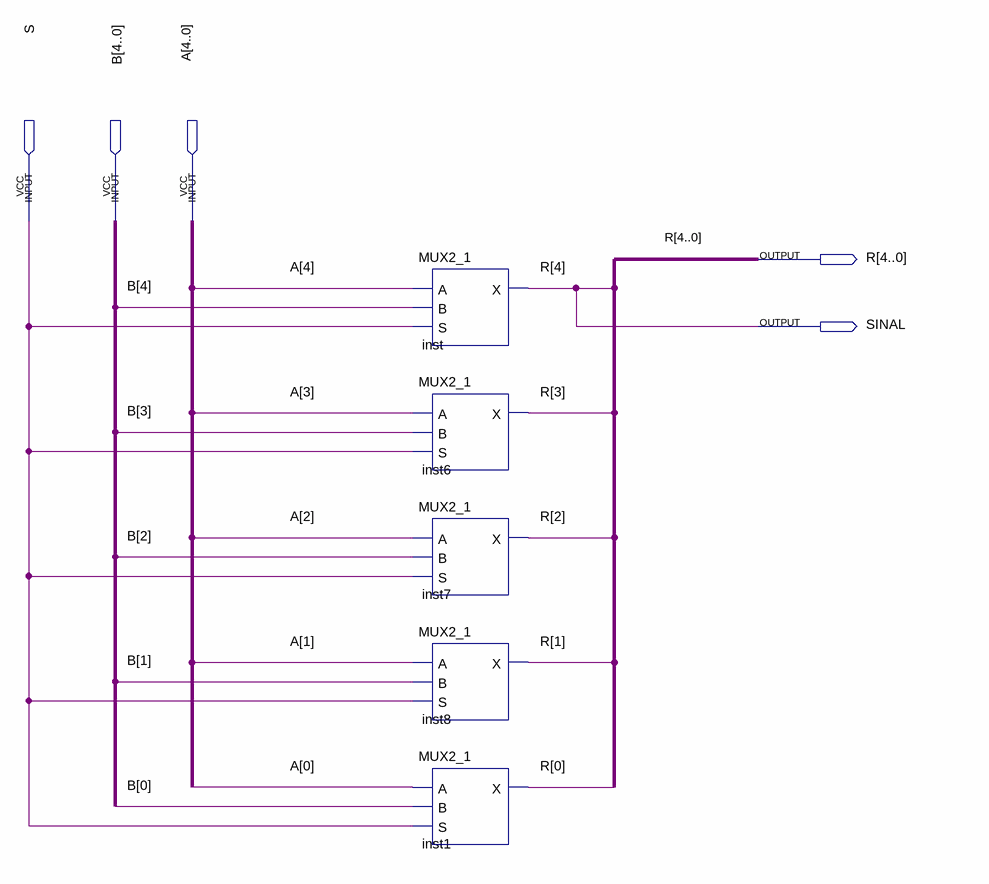
[diagram p0: schematic sheet]
// Quartus schematic MUX2_1_5BITS.bdf as structural Verilog: 5 symbols, 5 pins
module MUX2_1_5BITS (
  input  S,
  input  [4:0] B,
  input  [4:0] A,
  output [4:0] R,
  output SINAL
);

  MUX2_1 inst (.A(A[4]), .B(B[4]), .S(S), .X(R[4]));
  MUX2_1 inst6 (.A(A[3]), .B(B[3]), .S(S), .X(R[3]));
  MUX2_1 inst7 (.A(A[2]), .B(B[2]), .S(S), .X(R[2]));
  MUX2_1 inst8 (.A(A[1]), .B(B[1]), .S(S), .X(R[1]));
  MUX2_1 inst1 (.A(A[0]), .B(B[0]), .S(S), .X(R[0]));

  assign SINAL = R[4];
endmodule
